# EAGLE design mbc_81_24_01_06 (EAGLE 7.6.0)

## Sheet 1 of 2
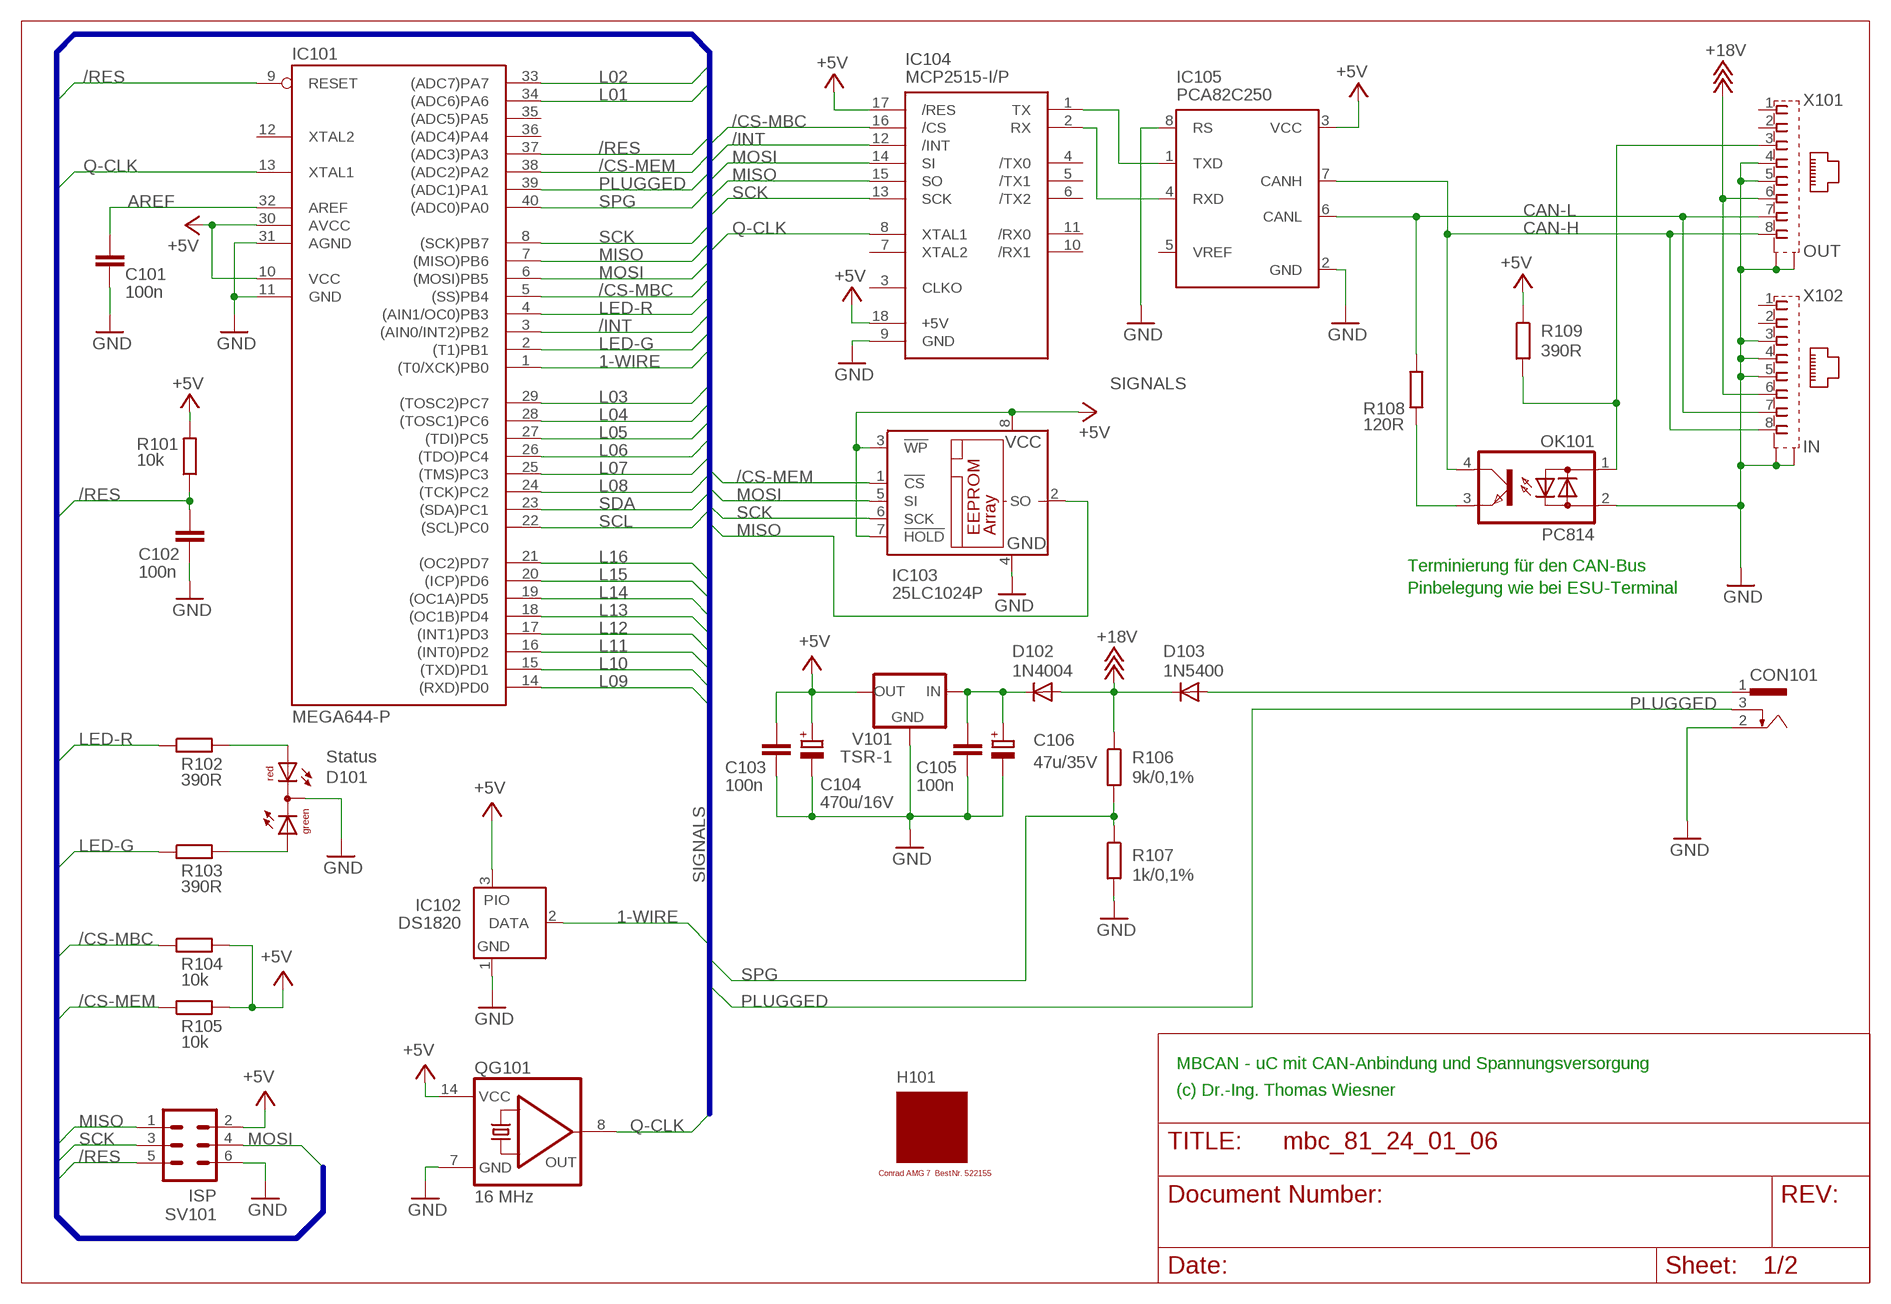
[diagram p0: schematic, sheet 1]

### Parts
C101  100n  C-EU025-025X050  [C025-025X050]
C102  100n  C-EU025-025X050  [C025-025X050]
C103  100n  C-EU025-025X050  [C025-025X050]
C104  470u/16V  CPOL-EUE3.5-8  [E3,5-8]
C105  100n  C-EU025-025X050  [C025-025X050]
C106  47u/35V  CPOL-EUE2.5-7  [E2,5-7]
CON101  POWER-JACK  [POWER-JACK]
D101  Status  DUOLED5MM  [DUOLED5MM]
D102  1N4004  [DO41-10]
D103  1N5400  [DO201-15]
H101  MODULGEHÄUSE-AMG-7  [MODULGEHÄUSE-1]
IC101  MEGA644-P  MEGA323-P  [DIL40]
IC102  DS1820  DS2405  [TO92-]
IC103  25LC1024P  25LC040P  [DIL8]
IC104  MCP2515-I/P  MCP2510-I/P  [DIL18]
IC105  PCA82C250  [DIL08]
OK101  PC814  [DIL04]
QG101  16 MHz  QG5860  [DIL14S]
R101  10k  R-EU_0207/10  [0207/10]
R102  390R  R-EU_0207/10  [0207/10]
R103  390R  R-EU_0207/10  [0207/10]
R104  10k  R-EU_0207/10  [0207/10]
R105  10k  R-EU_0207/10  [0207/10]
R106  9k/0,1%  R-EU_0207/10  [0207/10]
R107  1k/0,1%  R-EU_0207/10  [0207/10]
R108  120R  R-EU_0207/10  [0207/10]
R109  390R  R-EU_0207/10  [0207/10]
SV101  ISP  ML6  [ML6]
V101  TSR-1  [TRACO-TSR-1]
X101  OUT  0446200002  [0446200002]
X102  IN  0446200002  [0446200002]

### Nets
1-WIRE: IC101.1((T0/XCK)PB0) IC102.2(DATA)
+5V: C103.1 C104.+ IC101.10(VCC) IC101.30(AVCC) IC102.3(PIO) IC103.3(!WP) IC103.7(!HOLD) IC103.8(VCC) IC104.17(/RES) IC104.18(+5V) IC105.3(VCC) QG101.14(VCC) R101.2 R104.2 R105.2 R109.1 SV101.2 V101.OUT ; also sheet 2
+18V: D102.A D103.C R106.1 X101.6 X102.6
/CS-MBC: IC101.5((SS)PB4) IC104.16(/CS) R104.1
/CS-MEM: IC101.38((ADC2)PA2) IC103.1(!CS) R105.1
/INT: IC101.3((AIN0/INT2)PB2) IC104.12(/INT)
/RES: C102.1 IC101.9(RESET) IC101.37((ADC3)PA3) R101.1 SV101.5
AREF: C101.1 IC101.32(AREF)
CAN-H: IC105.7(CANH) OK101.4(C) X101.8 X102.8
CAN-L: IC105.6(CANL) R108.2 X101.7 X102.7
GND: C101.2 C102.2 C103.2 C104.- C105.2 C106.- CON101.2 D101.K(C) IC101.11(GND) IC101.31(AGND) IC102.1(GND) IC103.4(GND) IC104.9(GND) IC105.2(GND) IC105.8(RS) OK101.2(AC2) QG101.7(GND) R107.2 SV101.6 V101.GND X101.4 X101.5 X101.S@1(S1) X101.S@2(S2) X102.3 X102.4 X102.5 X102.S@1(S1) X102.S@2(S2) ; also sheet 2
L01: IC101.34((ADC6)PA6) ; also sheet 2
L02: IC101.33((ADC7)PA7) ; also sheet 2
L03: IC101.29((TOSC2)PC7) ; also sheet 2
L04: IC101.28((TOSC1)PC6) ; also sheet 2
L05: IC101.27((TDI)PC5) ; also sheet 2
L06: IC101.26((TDO)PC4) ; also sheet 2
L07: IC101.25((TMS)PC3) ; also sheet 2
L08: IC101.24((TCK)PC2) ; also sheet 2
L09: IC101.14((RXD)PD0) ; also sheet 2
L10: IC101.15((TXD)PD1) ; also sheet 2
L11: IC101.16((INT0)PD2) ; also sheet 2
L12: IC101.17((INT1)PD3) ; also sheet 2
L13: IC101.18((OC1B)PD4) ; also sheet 2
L14: IC101.19((OC1A)PD5) ; also sheet 2
L15: IC101.20((ICP)PD6) ; also sheet 2
L16: IC101.21((OC2)PD7) ; also sheet 2
LED-G: IC101.2((T1)PB1) R103.1
LED-R: IC101.4((AIN1/OC0)PB3) R102.1
MISO: IC101.7((MISO)PB6) IC103.2(SO) IC104.15(SO) SV101.1
MOSI: IC101.6((MOSI)PB5) IC103.5(SI) IC104.14(SI) SV101.4
N$1: IC104.1(TX) IC105.1(TXD)
N$2: IC104.2(RX) IC105.4(RXD)
N$3: OK101.3(E) R108.1
N$5: OK101.1(AC1) R109.2 X101.3
N$6: C105.1 C106.+ D102.C V101.IN
N$9: D101.AR R102.2
N$13: D101.AG R103.2
PLUGGED: CON101.3 IC101.39((ADC1)PA1)
Q-CLK: IC101.13(XTAL1) IC104.8(XTAL1) QG101.8(OUT)
SCK: IC101.8((SCK)PB7) IC103.6(SCK) IC104.13(SCK) SV101.3
SCL: IC101.22((SCL)PC0) ; also sheet 2
SDA: IC101.23((SDA)PC1) ; also sheet 2
SPG: IC101.40((ADC0)PA0) R106.2 R107.1
V-NETZTEIL1: CON101.1 D103.A
Unconnected: IC101.12(XTAL2) IC101.35((ADC5)PA5) IC101.36((ADC4)PA4) IC104.3(CLKO) IC104.4(/TX0) IC104.5(/TX1) IC104.6(/TX2) IC104.7(XTAL2) IC104.10(/RX1) IC104.11(/RX0) IC105.5(VREF) X101.1 X101.2 X102.1 X102.2

### Buses
SIGNALS

### Notes on the sheet
- Terminierung für den CAN-Bus
- Pinbelegung wie bei ESU-Terminal
- MBCAN - uC mit CAN-Anbindung und Spannungsversorgung
- (c) Dr.-Ing. Thomas Wiesner

## Sheet 2 of 2
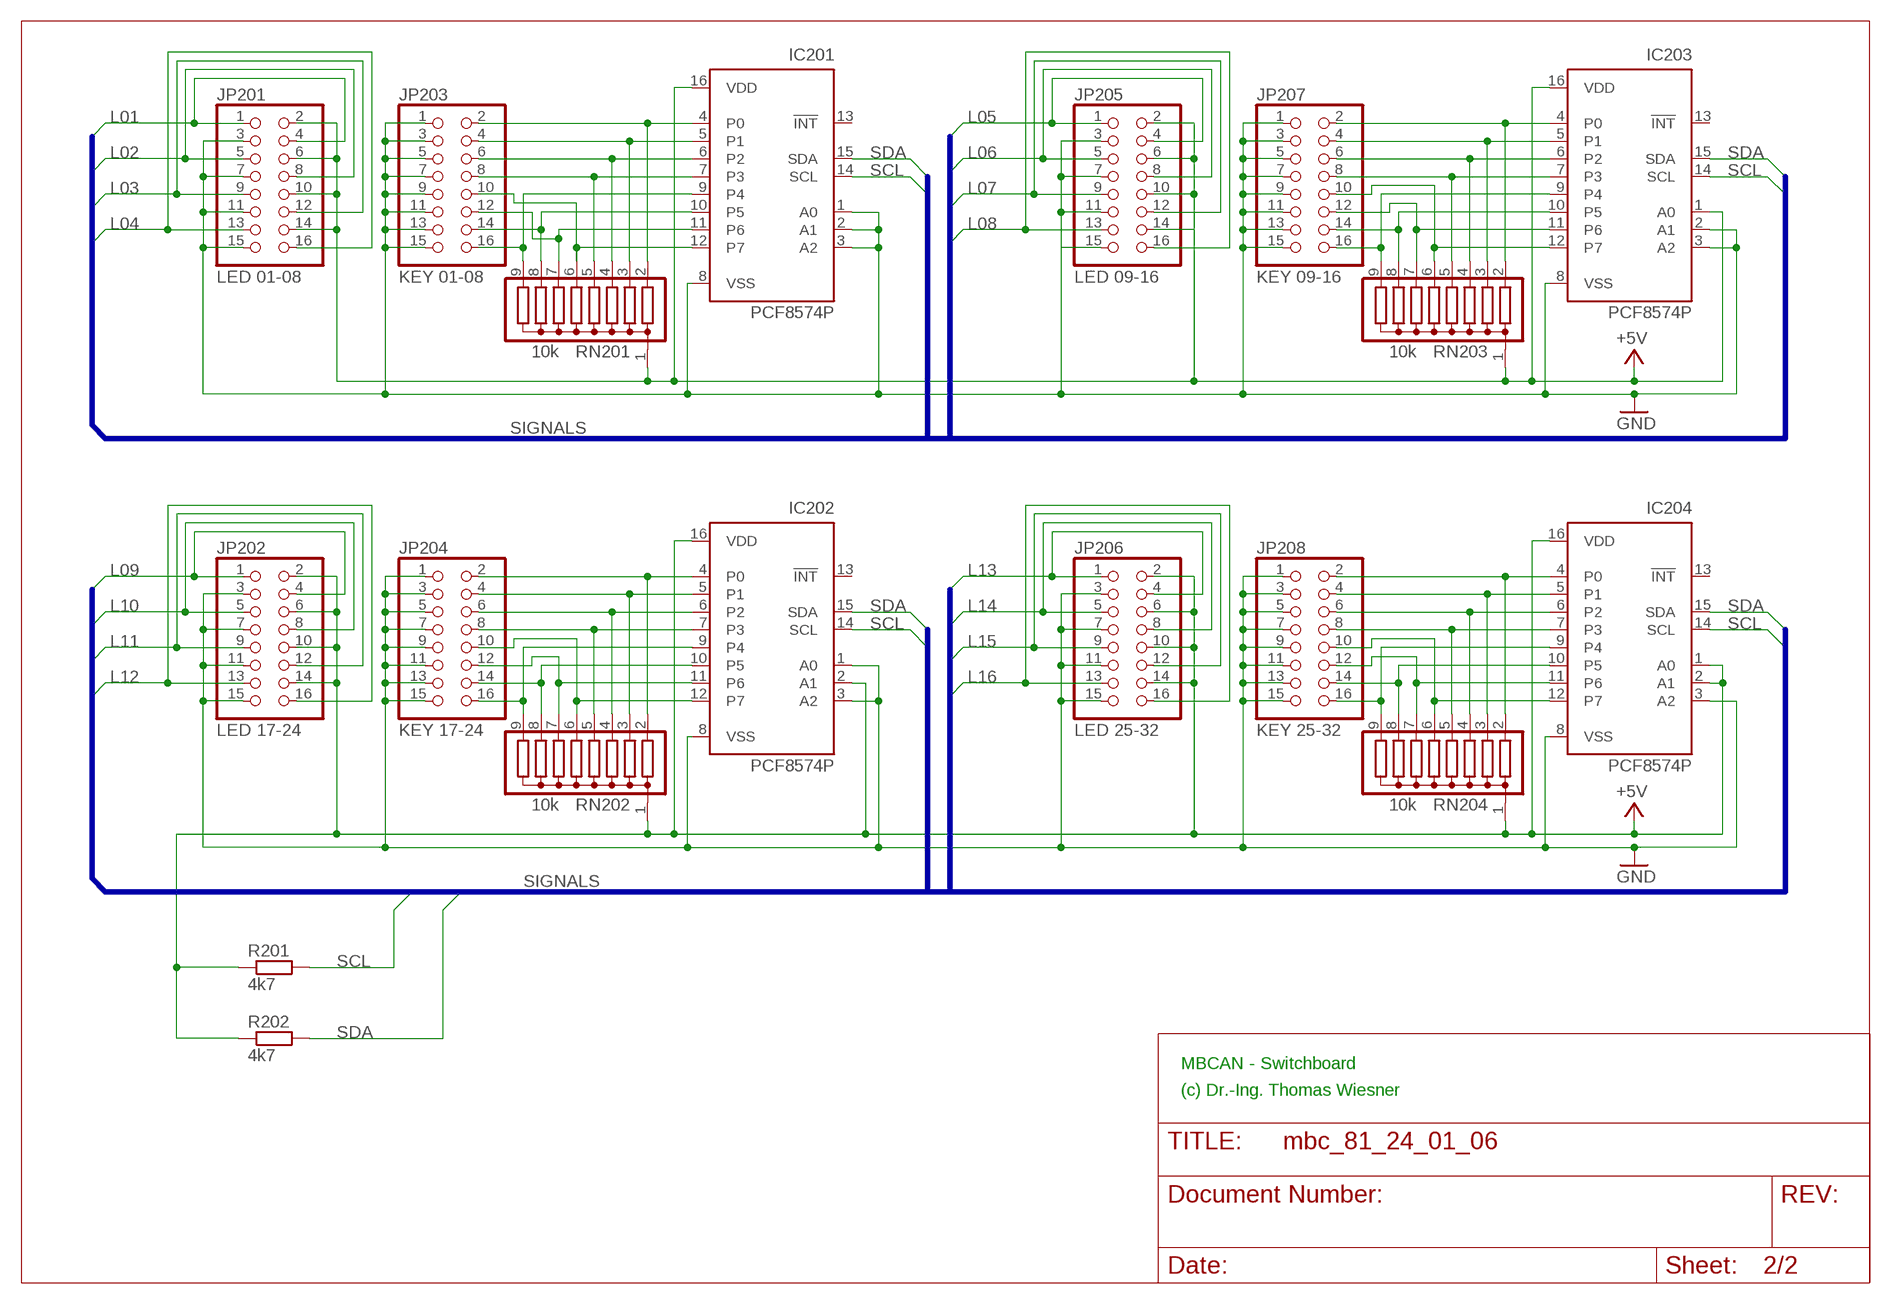
[diagram p1: schematic, sheet 2]

### Parts
IC201  PCF8574P  [DIL16]
IC202  PCF8574P  [DIL16]
IC203  PCF8574P  [DIL16]
IC204  PCF8574P  [DIL16]
JP201  LED 01-08  PINHD-2X8  [2X08]
JP202  LED 17-24  PINHD-2X8  [2X08]
JP203  KEY 01-08  PINHD-2X8  [2X08]
JP204  KEY 17-24  PINHD-2X8  [2X08]
JP205  LED 09-16  PINHD-2X8  [2X08]
JP206  LED 25-32  PINHD-2X8  [2X08]
JP207  KEY 09-16  PINHD-2X8  [2X08]
JP208  KEY 25-32  PINHD-2X8  [2X08]
R201  4k7  R-EU_0207/10  [0207/10]
R202  4k7  R-EU_0207/10  [0207/10]
RN201  10k  G08R  [SIL9]
RN202  10k  G08R  [SIL9]
RN203  10k  G08R  [SIL9]
RN204  10k  G08R  [SIL9]

### Nets
+5V: IC201.16(VDD) IC202.2(A1) IC202.16(VDD) IC203.1(A0) IC203.16(VDD) IC204.1(A0) IC204.2(A1) IC204.16(VDD) JP201.2 JP201.6 JP201.10 JP201.14 JP202.2 JP202.6 JP202.10 JP202.14 JP205.2 JP205.6 JP205.10 JP205.14 JP206.2 JP206.6 JP206.10 JP206.14 R201.1 R202.1 RN201.1 RN202.1 RN203.1 RN204.1 ; also sheet 1
GND: IC201.1(A0) IC201.2(A1) IC201.3(A2) IC201.8(VSS) IC202.1(A0) IC202.3(A2) IC202.8(VSS) IC203.2(A1) IC203.3(A2) IC203.8(VSS) IC204.3(A2) IC204.8(VSS) JP201.3 JP201.7 JP201.11 JP201.15 JP202.3 JP202.7 JP202.11 JP202.15 JP203.1 JP203.3 JP203.5 JP203.7 JP203.9 JP203.11 JP203.13 JP203.15 JP204.1 JP204.3 JP204.5 JP204.7 JP204.9 JP204.11 JP204.13 JP204.15 JP205.3 JP205.7 JP205.11 JP205.15 JP206.3 JP206.7 JP206.11 JP206.15 JP207.1 JP207.3 JP207.5 JP207.7 JP207.9 JP207.11 JP207.13 JP207.15 JP208.1 JP208.3 JP208.5 JP208.7 JP208.9 JP208.11 JP208.13 JP208.15 ; also sheet 1
L01: JP201.1 JP201.4 ; also sheet 1
L02: JP201.5 JP201.8 ; also sheet 1
L03: JP201.9 JP201.12 ; also sheet 1
L04: JP201.13 JP201.16 ; also sheet 1
L05: JP205.1 JP205.4 ; also sheet 1
L06: JP205.5 JP205.8 ; also sheet 1
L07: JP205.9 JP205.12 ; also sheet 1
L08: JP205.13 JP205.16 ; also sheet 1
L09: JP202.1 JP202.4 ; also sheet 1
L10: JP202.5 JP202.8 ; also sheet 1
L11: JP202.9 JP202.12 ; also sheet 1
L12: JP202.13 JP202.16 ; also sheet 1
L13: JP206.1 JP206.4 ; also sheet 1
L14: JP206.5 JP206.8 ; also sheet 1
L15: JP206.9 JP206.12 ; also sheet 1
L16: JP206.13 JP206.16 ; also sheet 1
N$15: IC202.4(P0) JP204.2 RN202.2
N$16: IC202.5(P1) JP204.4 RN202.3
N$17: IC202.6(P2) JP204.6 RN202.4
N$18: IC202.7(P3) JP204.8 RN202.5
N$19: IC202.12(P7) JP204.10 RN202.6
N$20: IC202.11(P6) JP204.12 RN202.7
N$21: IC202.10(P5) JP204.14 RN202.8
N$22: IC202.9(P4) JP204.16 RN202.9
N$23: IC201.4(P0) JP203.2 RN201.2
N$24: IC201.5(P1) JP203.4 RN201.3
N$25: IC201.6(P2) JP203.6 RN201.4
N$26: IC201.7(P3) JP203.8 RN201.5
N$27: IC201.9(P4) JP203.16 RN201.9
N$28: IC201.10(P5) JP203.14 RN201.8
N$29: IC201.11(P6) JP203.12 RN201.7
N$31: IC203.4(P0) JP207.2 RN203.2
N$32: IC203.5(P1) JP207.4 RN203.3
N$33: IC203.6(P2) JP207.6 RN203.4
N$34: IC203.7(P3) JP207.8 RN203.5
N$35: IC203.12(P7) JP207.10 RN203.6
N$36: IC203.11(P6) JP207.12 RN203.7
N$37: IC203.10(P5) JP207.14 RN203.8
N$38: IC203.9(P4) JP207.16 RN203.9
N$39: IC204.4(P0) JP208.2 RN204.2
N$40: IC204.5(P1) JP208.4 RN204.3
N$41: IC204.6(P2) JP208.6 RN204.4
N$42: IC204.7(P3) JP208.8 RN204.5
N$43: IC204.12(P7) JP208.10 RN204.6
N$44: IC204.11(P6) JP208.12 RN204.7
N$45: IC204.10(P5) JP208.14 RN204.8
N$46: IC204.9(P4) JP208.16 RN204.9
N$47: IC201.12(P7) JP203.10 RN201.6
SCL: IC201.14(SCL) IC202.14(SCL) IC203.14(SCL) IC204.14(SCL) R201.2 ; also sheet 1
SDA: IC201.15(SDA) IC202.15(SDA) IC203.15(SDA) IC204.15(SDA) R202.2 ; also sheet 1
Unconnected: IC201.13(!INT) IC202.13(!INT) IC203.13(!INT) IC204.13(!INT)

### Buses
SIGNALS

### Notes on the sheet
- MBCAN - Switchboard
- (c) Dr.-Ing. Thomas Wiesner

## Library data of the parts
C101-C103 C105 = rcl:C-EU: CAPACITOR, European symbol
C104 C106 = rcl:CPOL-EU: POLARIZED CAPACITOR, European symbol
CON101 = mbc:POWER-JACK
D101 = led:DUOLED5MM: DUO LED 2 colors, 5 mm, round
D102 = diode:1N4004: DIODE general purpose rectifier, 1 A
D103 = diode:1N5400: DIODE standard rectifier, 3 A, 50 V (Motorola)
H101 = mbc:MODULGEHÄUSE-AMG-7: Gehäuse Conrad AMG 7 BestNr. 522155
IC101 = atmel:MEGA323-P: MICROCONTROLLER 32 Kbytes FLASH 2 Kbytes SRAM 1 Kbytes EEPROM USART 8-channel 10 bit ADC Source: avr.lbr; OC_FARNELL: unknown; OC_NEWARK: unknown
IC102 = maxim:DS2405: Addressable Switch DALLAS Semiconductor; MF: DALLAS SEMICONDUCTOR; MPN: DS2405; OC_FARNELL: 1188025; OC_NEWARK: 06F4645
IC103 = microchip:25*: Serial EEPROM 4K/ 8K , SPI bus; MF: MICROCHIP; MPN: 25LC040/P; OC_FARNELL: 9758100; OC_NEWARK: 96K4091
IC104 = mbc:MCP2510: BASIC-CAN 2.0a Controller Stand-alone CAN controller von Microchip
IC105 = micro-philips:PCA82C250: CAN CONTROLLER INTERFACE; OC_FARNELL: 3692358; OC_NEWARK: unknown
IC201-IC204 = micro-philips:PCF8574: I2C-Bus Remote 8-bit I/O expander http://www.semiconductors.philips.com/acrobat_download/datasheets/PCF8574_4.pdf; MPN: PCF8574PN; OC_FARNELL: 204020; OC_NEWARK: 11N8515
JP201-JP208 = pinhead:PINHD-2X8: PIN HEADER
OK101 = optocoupler:PC814: SHARP OPTO COUPLER; OC_FARNELL: 9707662; OC_NEWARK: unknown
QG101 = crystal:QG5860: CRYSTAL RESONATOR; OC_FARNELL: unknown; OC_NEWARK: unknown
R101-R109 = resistor:R-EU_: RESISTOR, European symbol
R201 R202 = rcl:R-EU_: RESISTOR, European symbol
RN201-RN204 = resistor-sil:G08R: SIL RESISTOR; OC_FARNELL: unknown; OC_NEWARK: unknown
SV101 = con-ml:ML6: HARTING; OC_FARNELL: unknown; OC_NEWARK: unknown
V101 = mbc:TSR-1: Spannungsregler Hersteller: TRACO Typ: TSR-1 5V: TSR 1-2450 Spg: 5V Strom: 1A Reichelt TSR 1-2450
X101 X102 = mbc:0446200002: RJ-45 INVERTED MODULAR JACK ASSEMBLY WITH RJ-11 KEEPOUT FEATURE Source: Data sheet <http://www.farnell.com/datasheets/73207.pdf> MOLEX 0446200002 BUCHSE, RJ45, GESCHIRMT Source: Farnell <http://de.farnell.com/molex/0446200002/buchse-rj45-geschirmt/dp/9251910?ost=9251910>; MF: MOLEX; MPN: 0446200002; OC_FARNELL: 9251910

## Board
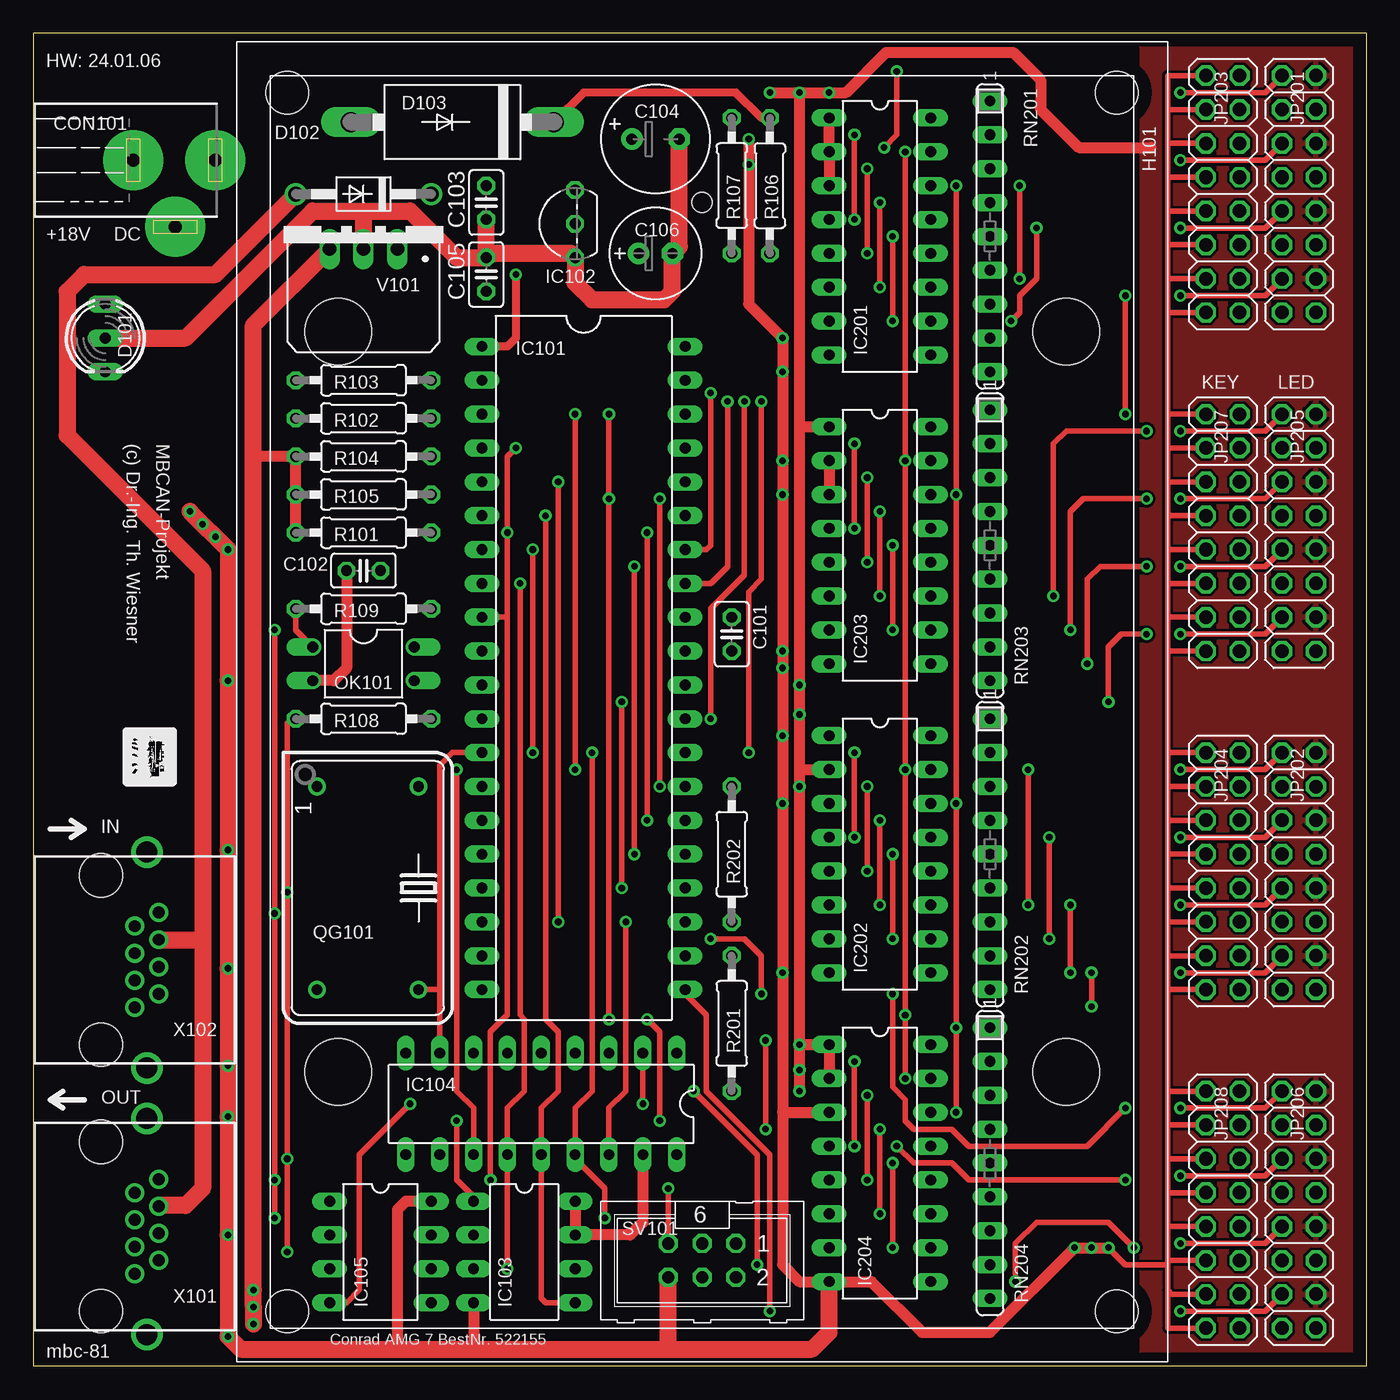
[diagram p2: board, top side]
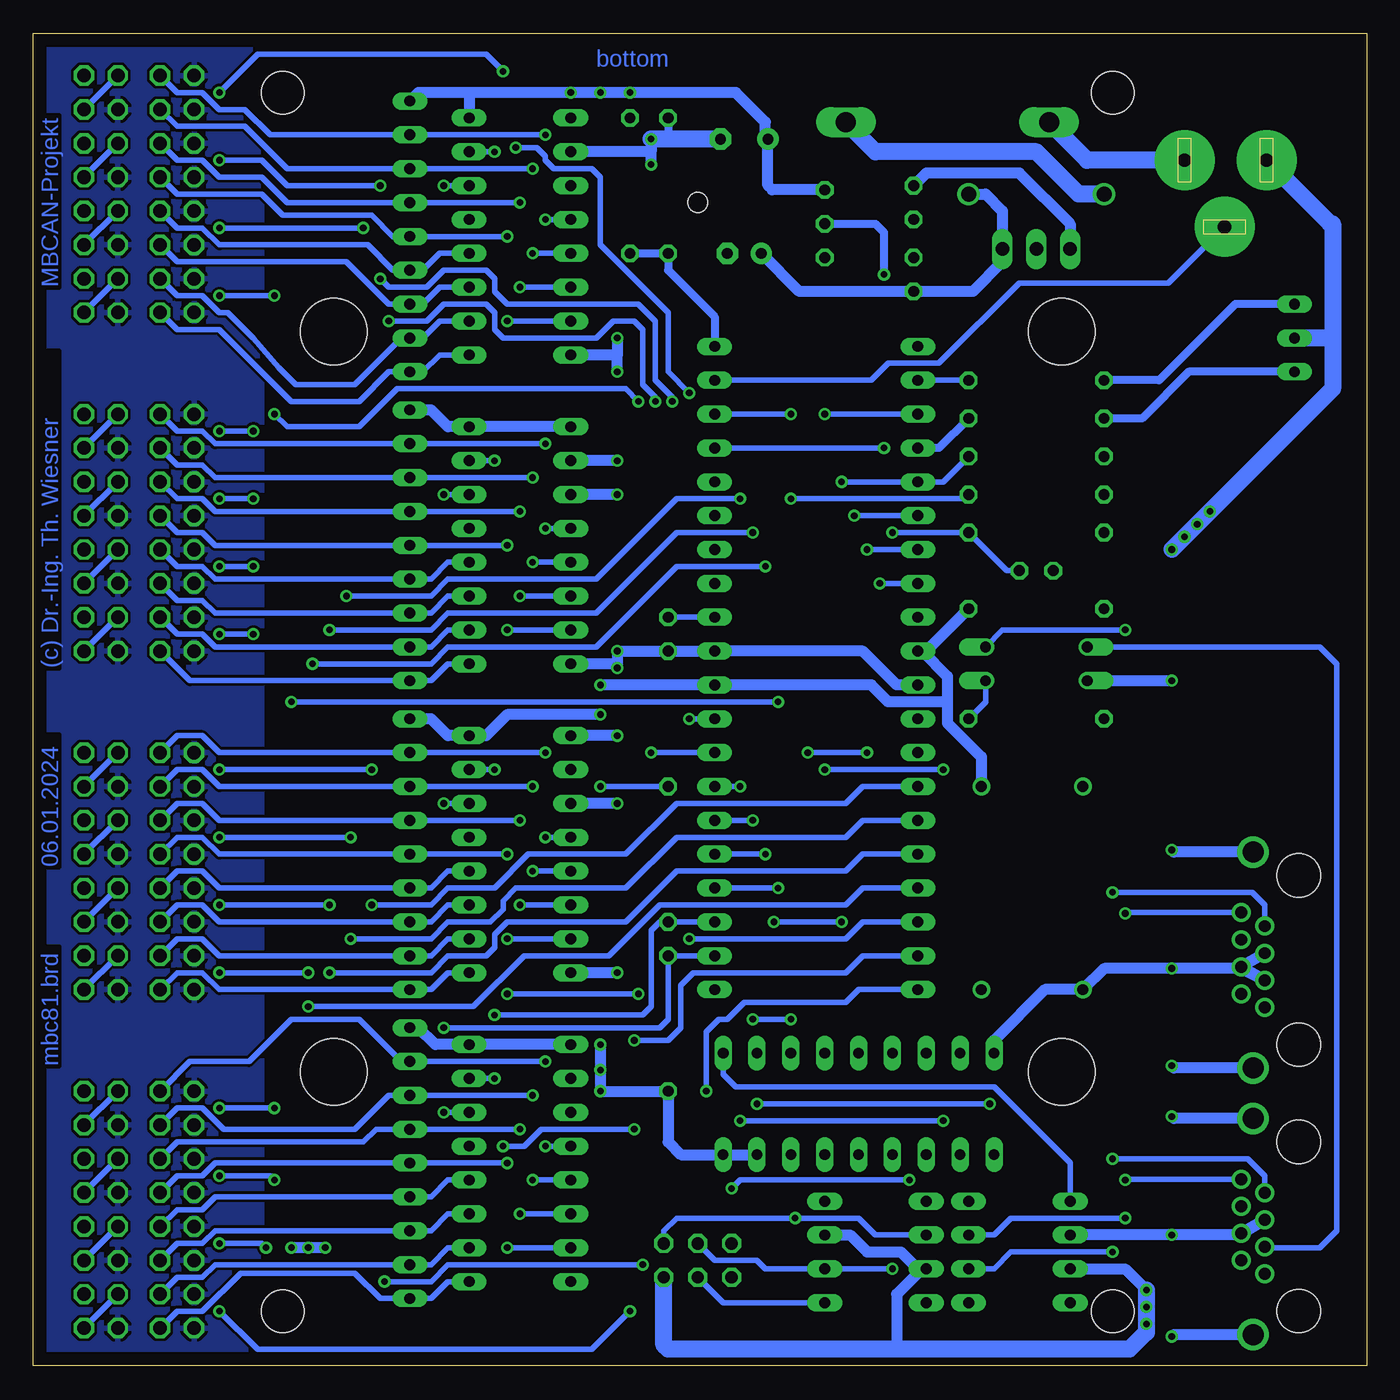
[diagram p3: board, bottom side, seen from below]

Size 100 x 99.99 mm. Coordinates in mm from the lower left corner, seen from the top.
Outline: 0,99.99 0,0 100,0 100,99.99 0,99.99
Copper layers (1*16): Top 0.035mm / dielectric 1.5mm / Bottom 0.035mm
Design rules "default *": minimum track width 10mil, minimum drill 0.5mm, track to track 8mil, track to pad 8mil, pad to pad 8mil, via to via 8mil, smd to smd 8mil, copper to edge 40mil, drill to drill 8mil, minimum pad ring 10mil, minimum via ring 8mil, stop-mask expansion 4mil, vias tented up to drill 0mil, thermal gap 10mil

### Footprints (pad centres in the part's own frame; a part is rotated, then mirrored left to right if it is on the bottom)
C025-025X050 = drill 0.813 octagon: 1 -1.27,0; 2 1.27,0
E3,5-8 = drill 0.813 pad 1.6: + -1.778,0 | drill 0.813 pad 1.6 octagon: - 1.778,0
E2,5-7 = drill 0.813 pad 1.6: + -1.27,0 | drill 0.813 pad 1.6 octagon: - 1.27,0
POWER-JACK = drill 1 pad 4.5: 1 0,6.03; 2 0,-0.12; 3 5,3.03
DUOLED5MM = drill 0.813 long: AG -2.54,0; AR 2.54,0; K 0,0
DO41-10 = drill 1.118: A 5.08,0; C -5.08,0
DO201-15 = drill 1.499 long: A 7.62,0; C -7.62,0
MODULGEHÄUSE-1 = hole 3.2: -45.72,-31.115; -45.72,31.115; 45.72,31.115; 45.72,-31.115 | hole 5: -27.781,-27.305; 27.781,-27.305; -27.781,27.305; 27.781,27.305 | hole 1.5: -37.465,0
DIL40 = drill 0.813 long: 1 -24.13,-7.62; 2 -21.59,-7.62; 3 -19.05,-7.62; 4 -16.51,-7.62; 5 -13.97,-7.62; 6 -11.43,-7.62; 7 -8.89,-7.62; 8 -6.35,-7.62; 9 -3.81,-7.62; 10 -1.27,-7.62; 11 1.27,-7.62; 12 3.81,-7.62; 13 6.35,-7.62; 14 8.89,-7.62; 15 11.43,-7.62; 16 13.97,-7.62; 17 16.51,-7.62; 18 19.05,-7.62; 19 21.59,-7.62; 20 24.13,-7.62; 21 24.13,7.62; 22 21.59,7.62; 23 19.05,7.62; 24 16.51,7.62; 25 13.97,7.62; 26 11.43,7.62; 27 8.89,7.62; 28 6.35,7.62; 29 3.81,7.62; 30 1.27,7.62; 31 -1.27,7.62; 32 -3.81,7.62; 33 -6.35,7.62; 34 -8.89,7.62; 35 -11.43,7.62; 36 -13.97,7.62; 37 -16.51,7.62; 38 -19.05,7.62; 39 -21.59,7.62; 40 -24.13,7.62
TO92- = drill 0.813 octagon: 1 -2.54,0; 2 0,0; 3 2.54,0
DIL8 = drill 0.813 long: 1 -3.81,-3.81; 2 -1.27,-3.81; 3 1.27,-3.81; 4 3.81,-3.81; 5 3.81,3.81; 6 1.27,3.81; 7 -1.27,3.81; 8 -3.81,3.81
DIL18 = drill 0.813 long: 1 -10.16,-3.81; 2 -7.62,-3.81; 3 -5.08,-3.81; 4 -2.54,-3.81 | drill 0.8 long: 5 0,-3.81; 6 2.54,-3.81; 7 5.08,-3.81; 8 7.62,-3.81; 9 10.16,-3.81; 10 10.16,3.81; 11 7.62,3.81; 12 5.08,3.81; 13 2.54,3.81; 14 0,3.81; 15 -2.54,3.81; 16 -5.08,3.81; 17 -7.62,3.81; 18 -10.16,3.81
DIL08 = drill 0.813 long: 1 -3.81,-3.81; 2 -1.27,-3.81; 3 1.27,-3.81; 4 3.81,-3.81; 5 3.81,3.81; 6 1.27,3.81; 7 -1.27,3.81; 8 -3.81,3.81
DIL16 = drill 0.813 long: 1 -8.89,-3.81; 2 -6.35,-3.81; 3 -3.81,-3.81; 4 -1.27,-3.81; 5 1.27,-3.81; 6 3.81,-3.81; 7 6.35,-3.81; 8 8.89,-3.81; 9 8.89,3.81; 10 6.35,3.81; 11 3.81,3.81; 12 1.27,3.81; 13 -1.27,3.81; 14 -3.81,3.81; 15 -6.35,3.81; 16 -8.89,3.81
2X08 = drill 1.016 octagon: 1 -8.89,-1.27; 2 -8.89,1.27; 3 -6.35,-1.27; 4 -6.35,1.27; 5 -3.81,-1.27; 6 -3.81,1.27; 7 -1.27,-1.27; 8 -1.27,1.27; 9 1.27,-1.27; 10 1.27,1.27; 11 3.81,-1.27; 12 3.81,1.27; 13 6.35,-1.27; 14 6.35,1.27; 15 8.89,-1.27; 16 8.89,1.27
DIL04 = drill 0.813 offset: 1 -1.27,-3.81; 2 1.27,-3.81; 3 1.27,3.81; 4 -1.27,3.81
DIL14S = drill 0.813: 1 -7.62,-3.81; 7 7.62,-3.81; 8 7.62,3.81; 14 -7.62,3.81
0207/10 = drill 0.813 octagon: 1 -5.08,0; 2 5.08,0
SIL9 = drill 0.813 long: 1 -10.16,0; 2 -7.62,0; 3 -5.08,0; 4 -2.54,0; 5 0,0; 6 2.54,0; 7 5.08,0; 8 7.62,0; 9 10.16,0
ML6 = drill 0.914 octagon: 1 -2.54,-1.27; 2 -2.54,1.27; 3 0,-1.27; 4 0,1.27; 5 2.54,-1.27; 6 2.54,1.27
TRACO-TSR-1 = drill 1.016 long: GND 0,2.54; IN -2.54,2.54; OUT 2.54,2.54
0446200002 = drill 0.889 pad 1.422: 1 3.556,2.54; 2 2.54,4.318; 3 1.524,2.54; 4 0.508,4.318; 5 -0.508,2.54; 6 -1.524,4.318; 7 -2.54,2.54; 8 -3.556,4.318 | drill 1.575 pad 2.286: S@1 -8.103,3.429; S@2 8.103,3.429 | hole 3.251: 6.35,0; -6.35,0

### Placement (x,y rotation side)
C101  52.39,54.91 270 top
C102  24.77,59.67 180 top
C103  33.97,87.29 270 top
C104  46.67,92.06 0 top
C105  33.97,81.9 90 top
C106  46.67,83.48 0 top
CON101  7.62,90.47 270 top
D101  5.4,77.13 270 top
D102  24.77,87.93 180 top
D103  31.43,93.33 180 top
H101  50.16,49.83 270 top
IC101  41.27,52.37 270 top
IC102  40.64,85.7 90 top
IC103  36.83,8.55 270 top
IC104  38.1,19.66 180 top
IC105  26.04,8.55 270 top
IC201  63.5,84.75 270 top
IC202  63.5,38.4 270 top
IC203  63.5,61.57 270 top
IC204  63.5,15.22 270 top
JP201  94.93,87.93 270 top
JP202  94.93,37.13 270 top
JP203  89.22,87.93 270 top
JP204  89.22,37.13 270 top
JP205  94.93,62.53 270 top
JP206  94.93,11.73 270 top
JP207  89.22,62.53 270 top
JP208  89.22,11.73 270 top
OK101  24.77,52.68 270 top
QG101  25.08,35.86 270 top
R101  24.77,62.53 180 top
R102  24.77,71.1 180 top
R103  24.77,73.96 180 top
R104  24.77,68.24 180 top
R105  24.77,65.39 180 top
R106  55.24,88.56 270 top
R107  52.39,88.56 90 top
R108  24.77,48.56 180 top
R109  24.77,56.81 180 top
R201  52.39,25.7 90 top
R202  52.39,38.4 270 top
RN201  71.75,84.75 270 top
RN202  71.75,38.4 270 top
RN203  71.75,61.57 270 top
RN204  71.75,15.22 270 top
SV101  50.16,7.92 180 top
V101  24.77,86.34 180 top
X101  5.08,10.46 270 top
X102  5.08,30.46 270 top

### Tracks (layer width: path | path; a pad name or v marks a point on that pad's centre or on a via)
1-WIRE  (via drill 0.5)
  Top 0.61: v36.2,81.9 36.2,77.13 35.56,76.5 IC101.1
  Bottom 0.61: IC102.2 36.83,85.7 36.2,85.07 v36.2,81.9
+5V  (via drill 0.5)
  Top 0.813: v57.47,95.55 v59.69,95.55 60.96,95.55 63.98,98.56 73.5,98.56 75.56,96.5 75.56,94.28 78.42,91.42 83.82,91.42 | v55.24,95.55 v57.47,95.55 | v57.47,95.55 57.47,70.47 | 57.47,70.47 v57.47,51.1 v57.47,48.88 57.47,44.75 | 57.47,44.75 v57.47,43.48 v57.47,24.11 | 57.47,70.47 IC203.1 | 57.47,44.75 IC202.2 | v57.47,24.11 IC204.1 IC204.2 | v57.47,24.11 v57.47,22.21 v57.47,20.62 | R101.2 R105.2 R104.2 16.51,68.24 | IC104.17 45.72,10.78 44.77,9.82 IC103.7 IC103.8
  Top 1.27: V101.OUT 16.51,78.09 16.51,68.24 v16.51,5.7 v16.51,4.43 v16.51,3.15
  Bottom 0.406: C104.+ 45.09,92.25 | v57.47,43.48 R202.1
  Bottom 0.813: IC104.17 IC104.18 51.44,15.86 52.39,16.81 R201.1 v57.47,20.62 v57.47,22.21 v57.47,24.11 | 33.34,53.64 31.43,51.73 31.43,49.83 | QG101.14 28.89,45.7 31.43,48.24 31.43,49.83 | IC102.3 44.58,88.25 44.9,88.56 C104.+ | V101.OUT 22.23,85.7 26.04,89.52 33.02,89.52 C103.1 | 45.09,92.25 45.09,93.33 47.31,95.55 v55.24,95.55 v57.47,95.55 v59.69,95.55 67.31,95.55 | 31.43,49.83 35.88,49.83 37.15,51.1 IC101.30 v57.47,51.1 | 67.31,95.55 71.12,95.55 RN201.1 | 67.31,95.55 IC201.16 | IC203.1 IC203.16 68.9,70.47 70.17,71.73 RN203.1 | RN202.1 70.17,48.56 68.9,47.29 IC202.16 66.04,47.29 64.45,48.88 v57.47,48.88 | RN204.1 71.12,25.38 69.85,24.11 IC204.16 IC204.1 | IC101.10 33.34,53.64 | 33.34,53.64 33.02,53.64 R109.1 | IC105.3 18.1,7.28 v16.51,5.7 | IC103.7 38.73,9.82 37.47,8.55 34.92,8.55 33.66,7.28 IC103.3 33.34,7.28 35.24,5.38 35.24,1.25
  Bottom 1.27: SV101.2 52.7,1.57 52.39,1.25 35.24,1.25 17.78,1.25 16.51,2.52 v16.51,3.15 v16.51,4.43 v16.51,5.7
  pour Top: 99.69,99.67 83.19,99.67 83.19,0.3 99.69,0.3
+18V
  Top 0.61: R106.1 54.61,93.64 52.7,95.55 41.27,95.55 D103.C
  Top 1.27: 12.7,32.05 12.7,59.67 2.54,69.83 2.54,80.62 3.81,81.9 13.65,81.9 D102.A | 12.7,32.05 12.7,13.32 11.43,12.04 9.46,12.04 X101.6 | X102.6 12.64,31.98 12.7,32.05
  Bottom 1.27: D102.A 21.59,87.93 24.77,91.1 36.83,91.1 D103.C
/CS-MBC  (via drill 0.5)
  Top 0.406: v39.37,66.34 v39.37,33.32 | v44.45,33.32 44.45,20.62 43.18,19.35 IC104.16
  Bottom 0.406: v39.37,66.34 IC101.5 31.75,66.34 R104.1 | v39.37,33.32 v44.45,33.32
/CS-MEM  (via drill 0.5)
  Top 0.406: v43.18,26.02 v43.18,65.07 v43.18,71.42 | IC103.1 33.02,12.68 31.75,13.95 v31.75,18.39 | v46.99,18.39 46.99,25.06 v46.04,26.02
  Bottom 0.406: v43.18,65.07 30.16,65.07 R105.1 | IC101.38 v43.18,71.42 | v31.75,18.39 v46.99,18.39 | v46.04,26.02 v43.18,26.02
/INT  (via drill 0.5)
  Top 0.406: IC104.12 33.02,19.35 31.75,20.62 v31.75,44.75 | v40.64,44.75 v40.64,71.42
  Bottom 0.406: v31.75,44.75 v40.64,44.75 | v40.64,71.42 IC101.3
/RES  (via drill 0.5)
  Top 0.406: 35.56,56.18 35.56,26.33 34.29,25.06 v34.29,13.95 | IC101.9 35.56,56.18 | 35.56,56.18 v35.56,62.53 35.56,68.24 v36.2,68.88 | v47.62,13.32 SV101.5
  Bottom 0.406: v36.2,68.88 IC101.37 | v35.56,62.53 R101.1 26.99,59.67 C102.1 | v34.29,13.95 46.99,13.95 v47.62,13.32
AREF
  Bottom 0.406: IC101.32 C101.1
CAN-H  (via drill 0.5)
  Top 0.406: v18.1,55.22 v18.1,33.95 v18.1,13.95 v18.1,11.09
  Bottom 0.406: X101.8 18.03,14.01 v18.1,13.95 | v18.1,55.22 27.3,55.22 OK101.4 | X102.8 18.03,34.02 v18.1,33.95 | v18.1,11.09 26.67,11.09 27.94,9.82 IC105.7
CAN-L  (via drill 0.5)
  Top 0.406: R108.2 19.37,48.56 19.05,48.24 v19.05,35.54 v19.05,15.54 v19.05,8.55
  Bottom 0.406: v19.05,8.55 26.67,8.55 27.94,7.28 IC105.6 | X101.7 7.62,14.27 8.89,15.54 v19.05,15.54 | X102.7 7.62,34.59 8.57,35.54 v19.05,35.54
GND  (via drill 0.5)
  Top 0.406: 85.09,94.28 85.09,96.82 JP203.1 | 85.09,91.74 85.09,94.28 | 85.09,89.2 85.09,91.74 | 85.09,86.66 85.09,89.2 | 85.09,84.12 85.09,86.66 | 85.09,81.58 85.09,84.12 | 85.09,79.04 85.09,81.58 | 85.09,94.28 JP203.3 | 85.09,91.74 JP203.5 | 85.09,89.2 JP203.7 | 85.09,86.66 JP203.9 | 85.09,84.12 JP203.11 | 85.09,81.58 JP203.13 | 85.09,79.04 JP203.15 | 85.09,71.42 85.09,79.04 | 85.09,68.88 85.09,71.42 | 85.09,66.34 85.09,68.88 | 85.09,63.8 85.09,66.34 | 85.09,61.26 85.09,63.8 | 85.09,58.72 85.09,61.26 | 85.09,56.18 85.09,58.72 | 85.09,53.64 85.09,56.18 | 85.09,46.02 85.09,53.64 | 85.09,43.48 85.09,46.02 | 85.09,40.94 85.09,43.48 | 85.09,38.4 85.09,40.94 | 85.09,35.86 85.09,38.4 | 85.09,33.32 85.09,35.86 | 85.09,30.78 85.09,33.32 | 85.09,28.24 85.09,30.78 | 85.09,20.62 85.09,28.24 | 85.09,18.08 85.09,20.62 | 85.09,15.54 85.09,18.08 | 85.09,13 85.09,15.54 | 85.09,10.46 85.09,13 | 85.09,7.6 85.09,5.7 | 85.09,5.7 85.09,2.84 JP208.15 | JP208.13 85.41,5.38 85.09,5.7 | 85.09,7.92 JP208.11 | 85.09,10.46 JP208.9 | 85.09,13 JP208.7 | 85.09,15.54 JP208.5 | 85.09,18.08 JP208.3 | 85.09,20.62 JP208.1 | 85.09,28.24 JP204.15 | 85.09,30.78 JP204.13 | 85.09,33.32 JP204.11 | 85.09,35.86 JP204.9 | 85.09,38.4 JP204.7 | 85.09,40.94 JP204.5 | 85.09,43.48 JP204.3 | 85.09,46.02 JP204.1 | 85.09,53.64 JP207.15 | 85.09,56.18 JP207.13 | 85.09,58.72 JP207.11 | 85.09,61.26 JP207.9 | 85.09,63.8 JP207.7 | 85.09,66.34 JP207.5 | 85.09,68.88 JP207.3 | 85.09,71.42 JP207.1 | 85.09,7.92 85.09,10.46 | v80.64,8.87 81.92,7.6 85.09,7.6 | 85.09,7.6 85.09,7.92 | v14.61,61.26 14.92,55.54
  Top 0.813: v53.66,92.06 v53.66,90.15 53.66,79.67 v56.2,77.13 v56.2,74.59 v56.2,67.92 v56.2,65.39 v56.2,53.64 v56.2,52.37 v56.2,47.29 v56.2,42.21 v56.2,29.51 56.2,19.03 | 56.2,19.03 56.2,7.6 57.47,6.33 IC204.8 62.87,6.33 66.67,2.52 71.75,2.52 v78.11,8.87 v79.38,8.87 v80.64,8.87 | 56.2,19.03 IC204.3 | IC201.1 IC201.2 IC201.3 | IC203.2 IC203.3 | C102.2 23.5,52.37 22.54,51.41 OK101.2 | IC105.8 27.94,12.36 27.3,11.73 27.3,1.25 | IC103.4 33.02,1.57 32.7,1.25
  Top 1.27: v11.75,64.12 v14.61,61.26 v14.61,51.41 v14.61,38.71 v14.61,29.82 v14.61,22.52 v14.61,18.71 v14.61,9.82 v14.61,2.2 15.56,1.25 27.3,1.25 32.7,1.25 47.62,1.25 | C104.- 48.45,83.99 C106.- 47.94,80.62 47.31,79.99 41.91,79.99 40.64,81.26 IC102.1 40.32,83.48 33.97,83.48 C105.2 | 24.77,86.66 V101.GND | 24.77,86.66 28.26,86.66 31.75,83.17 C105.2 | D101.K 11.43,77.13 20.95,86.66 24.77,86.66 | 47.62,1.25 SV101.6 | 47.62,1.25 58.42,1.25 59.69,2.52 IC204.8 | C105.2 C103.2
  Bottom 0.61: R107.2 52.39,92.37 52.7,92.06
  Bottom 0.813: IC101.11 35.24,51.1 37.78,53.64 IC101.31 C101.2 v56.2,53.64 56.2,52.68 | 53.66,91.1 IC201.2 | v53.66,92.06 53.66,91.1 | v53.66,90.15 53.66,91.1 | 56.2,75.86 IC201.8 | v56.2,77.13 56.2,75.86 | v56.2,74.59 56.2,75.86 | v56.2,67.92 IC203.2 | v56.2,65.39 IC203.3 | 56.2,52.68 IC203.8 | v56.2,52.37 56.2,52.68 | v56.2,47.29 IC202.1 | v56.2,42.21 IC202.3 | v56.2,29.51 IC202.8 | v80.64,8.87 v79.38,8.87 v78.11,8.87 | OK101.2 v14.61,51.41 | X102.S@1 14.45,38.56 v14.61,38.71 | X102.S@2 14.44,22.36 v14.61,22.52 | X101.S@1 14.45,18.56 v14.61,18.71 | X101.S@2 14.45,2.35 v14.61,2.2 | X102.5 X102.4 X102.3 9.53,29.82 v14.61,29.82 19.68,29.82 QG101.7 24.13,28.24 27.94,24.43 IC104.9 | X101.4 X101.5 9.53,9.82 v14.61,9.82 IC105.2
  Bottom 1.27: 2.54,77.13 2.54,85.7 2.74,85.7 CON101.2 | 2.54,77.13 D101.K | 2.54,77.13 2.54,73.32 v11.75,64.12 v12.7,63.16 v13.65,62.21 v14.61,61.26 | C104.- 52.7,92.06 v53.66,92.06
  pour Bottom: 99.69,99.67 82.87,99.67 82.87,0.3 99.69,0.3
L01  (via drill 0.5)
  Top 0.406: JP201.1 92.39,95.55 v86.04,95.55 | v64.77,97.14 64.77,92.37 v63.82,91.42 | v50.8,73.01 50.8,61.57 50.48,61.26 IC101.34
  Bottom 0.406: JP201.1 JP201.4 | v86.04,95.55 83.19,98.41 66.04,98.41 v64.77,97.14 | v63.82,91.42 62.23,91.42 61.59,90.79 61.59,90.47 60.96,89.83 58.1,89.83 57.47,89.2 57.47,84.12 52.39,79.04 52.39,74.59 v50.8,73.01
L02  (via drill 0.5)
  Top 0.406: JP201.5 92.39,90.47 v86.04,90.47 | v73.98,81.58 v73.98,88.56 | v52.07,72.37 52.07,59.99 50.8,58.72 IC101.33
  Bottom 0.406: JP201.5 JP201.8 | v86.04,90.47 82.87,90.47 80.96,88.56 v73.98,88.56 | v73.98,81.58 73.34,80.94 70.48,80.94 69.22,82.21 66.04,82.21 65.41,81.58 65.41,80.62 64.45,79.67 54.61,79.67 53.34,78.4 53.34,73.96 52.07,72.69 v52.07,72.37
L03  (via drill 0.5)
  Top 0.406: JP201.9 92.39,85.39 v86.04,85.39 | v75.25,85.39 75.25,81.58 73.98,80.31 73.98,79.04 v73.34,78.4 | v53.34,72.37 53.34,59.35 50.8,56.81 v50.8,48.56
  Bottom 0.406: JP201.9 JP201.12 | v75.25,85.39 v86.04,85.39 | v73.34,78.4 70.48,78.4 69.22,79.67 66.04,79.67 65.41,79.04 65.41,77.77 64.77,77.13 57.78,77.13 56.52,78.4 54.93,78.4 54.29,77.77 54.29,73.64 53.34,72.69 v53.34,72.37 | v50.8,48.56 IC101.29
L04  (via drill 0.5)
  Top 0.406: JP201.13 92.39,80.31 v86.04,80.31 | v81.92,71.42 v81.92,80.31 | v54.61,72.37 54.61,59.03 53.66,58.08 v53.66,46.02
  Bottom 0.406: JP201.13 JP201.16 | v81.92,80.31 v86.04,80.31 | v81.92,71.42 80.96,70.47 75.56,70.47 72.71,73.32 55.56,73.32 v54.61,72.37 | v53.66,46.02 IC101.28
L05  (via drill 0.5)
  Top 0.406: JP205.1 92.39,70.15 v86.04,70.15 | v46.99,65.07 v46.99,43.48 | v76.52,57.76 76.52,69.2 77.47,70.15 v83.5,70.15
  Bottom 0.406: JP205.1 JP205.4 | v46.99,43.48 IC101.27 | v46.99,65.07 51.75,65.07 57.78,59.03 68.9,59.03 70.17,57.76 v76.52,57.76 | v83.5,70.15 v86.04,70.15
L06  (via drill 0.5)
  Top 0.406: JP205.5 92.39,65.07 v86.04,65.07 | v83.5,65.07 78.74,65.07 77.79,64.12 v77.79,55.22 | v46.04,62.53 v46.04,40.94
  Bottom 0.406: JP205.5 JP205.8 | v83.5,65.07 v86.04,65.07 | v77.79,55.22 70.17,55.22 68.9,56.49 57.78,56.49 51.75,62.53 v46.04,62.53 | v46.04,40.94 IC101.26
L07  (via drill 0.5)
  Top 0.406: JP205.9 92.39,59.99 v86.04,59.99 | v83.5,59.99 80.01,59.99 79.06,59.03 v79.06,52.68 | v45.09,59.99 v45.09,38.4
  Bottom 0.406: JP205.9 JP205.12 | v83.5,59.99 v86.04,59.99 | v79.06,52.68 70.17,52.68 68.9,53.95 57.78,53.95 51.75,59.99 v45.09,59.99 | v45.09,38.4 IC101.25
L08  (via drill 0.5)
  Top 0.406: JP205.13 92.39,54.91 v86.04,54.91 | v83.5,54.91 81.6,54.91 80.64,53.95 v80.64,49.83 | v44.13,49.83 v44.13,35.86
  Bottom 0.406: JP205.13 JP205.16 | v83.5,54.91 v86.04,54.91 | v44.13,49.83 v80.64,49.83 | v44.13,35.86 IC101.24
L09  (via drill 0.5)
  Top 0.406: JP202.1 92.39,44.75 v86.04,44.75 | v74.61,34.59 v74.61,44.75
  Bottom 0.406: JP202.1 JP202.4 | v74.61,44.75 v86.04,44.75 | v74.61,34.59 70.17,34.59 68.9,35.86 65.41,35.86 62.87,38.4 55.56,38.4 51.75,42.21 39.05,42.21 37.78,43.48 IC101.14
L10  (via drill 0.5)
  Top 0.406: JP202.5 92.39,39.67 v86.04,39.67 | v76.2,32.05 v76.2,39.67
  Bottom 0.406: JP202.5 JP202.8 | v76.2,39.67 v86.04,39.67 | v76.2,32.05 70.17,32.05 68.9,33.32 65.72,33.32 64.77,34.27 64.77,34.9 63.82,35.86 55.56,35.86 51.75,39.67 39.05,39.67 37.78,40.94 IC101.15
L11  (via drill 0.5)
  Top 0.406: JP202.9 92.39,34.59 v86.04,34.59 | v77.79,29.51 v77.79,34.59
  Bottom 0.406: JP202.9 JP202.12 | v77.79,34.59 v86.04,34.59 | v77.79,29.51 70.17,29.51 68.9,30.78 66.04,30.78 65.41,31.41 65.41,32.36 64.45,33.32 55.56,33.32 51.75,37.13 39.05,37.13 37.78,38.4 IC101.16
L12  (via drill 0.5)
  Top 0.406: JP202.13 92.39,29.51 v86.04,29.51 | v79.38,26.97 v79.38,29.51
  Bottom 0.406: JP202.13 JP202.16 | v79.38,29.51 v86.04,29.51 | v79.38,26.97 66.99,26.97 63.18,30.78 56.83,30.78 53.02,34.59 39.05,34.59 37.78,35.86 IC101.17
L13  (via drill 0.5)
  Top 0.406: JP206.1 92.39,19.35 v86.04,19.35 | v50.8,32.05 53.34,32.05 54.61,30.78 v54.61,27.92 | v64.45,27.92 64.45,20.93 65.41,19.98 65.41,18.39 66.04,17.76 68.9,17.76 70.17,16.49 79.06,16.49 v81.92,19.35
  Bottom 0.406: JP206.1 JP206.4 | IC101.18 37.78,33.32 39.05,32.05 v50.8,32.05 | v54.61,27.92 v64.45,27.92 | v81.92,19.35 v86.04,19.35
L14  (via drill 0.5)
  Top 0.406: JP206.5 92.39,14.27 v86.04,14.27 | v54.93,24.43 v54.93,17.76 | v64.77,16.49 66.04,15.22 68.9,15.22 70.17,13.95 v81.92,13.95
  Bottom 0.406: JP206.5 JP206.8 | IC101.19 37.78,30.78 39.05,29.51 50.48,29.51 51.44,28.55 51.44,25.38 52.39,24.43 v54.93,24.43 | v54.93,17.76 61.91,17.76 63.18,16.49 v64.77,16.49 | v81.92,13.95 82.23,14.27 v86.04,14.27
L15  (via drill 0.5)
  Top 0.406: JP206.9 92.39,9.19 v86.04,9.19 | v49.53,20.62 54.29,15.86 v54.29,7.6 | v82.55,8.87 80.64,10.78 75.25,10.78 73.66,9.19 v73.66,6.33
  Bottom 0.406: JP206.9 JP206.12 | IC101.20 38.1,28.24 39.05,27.29 46.67,27.29 47.94,26.02 48.58,26.02 49.53,25.06 v49.53,20.62 | v54.29,7.6 68.9,7.6 70.17,6.33 v73.66,6.33 | v86.04,9.19 82.87,9.19 v82.55,8.87
L16  (via drill 0.5)
  Top 0.406: JP206.13 92.39,4.11 v86.04,4.11 | IC101.21 48.9,27.92 50.48,26.33 50.48,20.62 55.24,15.86 v55.24,4.11
  Bottom 0.406: JP206.13 JP206.16 | v55.24,4.11 58.1,1.25 83.19,1.25 v86.04,4.11
LED-G
  Bottom 0.406: IC101.2 R103.1
LED-R
  Bottom 0.61: IC101.4 32.07,68.88 R102.1
MISO  (via drill 0.5)
  Top 0.406: v37.47,61.26 v37.47,46.02 | v41.91,46.02 41.91,20.62 40.64,19.35 IC104.15 40.64,15.54 42.86,13.32 v42.86,11.09
  Bottom 0.406: IC101.7 v37.47,61.26 | v37.47,46.02 v41.91,46.02 | SV101.1 52.7,10.14 51.75,11.09 v42.86,11.09 38.1,11.09 36.83,9.82 IC103.2
MOSI  (via drill 0.5)
  Top 0.406: v38.42,63.8 38.42,26.02 39.37,25.06 39.37,20.62 38.1,19.35 IC104.14 38.1,5.06 38.42,4.74 IC103.5
  Bottom 0.406: IC101.6 v38.42,63.8 | IC103.5 48.26,4.74 SV101.4
N$1
  Bottom 0.406: IC105.1 22.23,15.22 27.94,20.93 47.31,20.93 48.26,21.89 IC104.1
N$2  (via drill 0.5)
  Top 0.406: IC105.4 23.5,4.74 24.45,5.7 24.45,15.86 v28.26,19.66 | v45.72,19.66 IC104.2
  Bottom 0.406: v28.26,19.66 v45.72,19.66
N$3
  Bottom 0.406: OK101.3 28.57,49.83 R108.1
N$5
  Top 0.406: R109.2 19.68,55.22 OK101.1
  Bottom 0.406: OK101.1 3.49,53.95 2.22,52.68 2.22,10.14 3.49,8.87 7.56,8.87 X101.3
N$6
  Bottom 0.813: D102.C 28.57,87.93 27.3,86.66 V101.IN 27.3,82.85 29.53,80.62 C105.1 42.55,80.62 C106.+
N$9
  Bottom 0.61: R102.2 16.83,71.1 13.34,74.59 D101.AR
N$13
  Bottom 0.61: R103.2 15.56,73.96 9.84,79.67 D101.AG
N$15  (via drill 0.5)
  Top 0.406: v61.59,46.02 v61.59,39.67
  Bottom 0.406: JP204.2 89.22,47.29 87.31,47.29 86.04,46.02 RN202.2 v61.59,46.02 | v61.59,39.67 IC202.4
N$16  (via drill 0.5)
  Top 0.406: v62.55,43.48 v62.55,37.13
  Bottom 0.406: JP204.4 89.22,44.75 87.31,44.75 86.04,43.48 RN202.3 v62.55,43.48 | v62.55,37.13 IC202.5
N$17  (via drill 0.5)
  Top 0.406: v63.5,34.59 v63.5,40.94
  Bottom 0.406: JP204.6 89.22,42.21 87.31,42.21 86.04,40.94 RN202.4 v63.5,40.94 | IC202.6 v63.5,34.59
N$18  (via drill 0.5)
  Top 0.406: v64.45,32.05 v64.45,38.4
  Bottom 0.406: JP204.8 89.22,39.67 87.31,39.67 86.04,38.4 RN202.5 v64.45,38.4 | IC202.7 v64.45,32.05
N$19
  Bottom 0.406: JP204.10 89.22,37.13 87.31,37.13 86.04,35.86 RN202.6 70.17,35.86 68.9,37.13 IC202.12
N$20
  Bottom 0.406: JP204.12 89.22,34.59 87.31,34.59 86.04,33.32 RN202.7 70.17,33.32 68.9,34.59 IC202.11
N$21
  Bottom 0.406: JP204.14 89.22,32.05 87.31,32.05 86.04,30.78 RN202.8 70.17,30.78 68.9,32.05 IC202.10
N$22
  Bottom 0.406: JP204.16 89.22,29.51 87.31,29.51 86.04,28.24 RN202.9 70.17,28.24 68.9,29.51 IC202.9
N$23  (via drill 0.5)
  Top 0.406: v61.59,92.37 v61.59,86.02
  Bottom 0.406: JP203.2 89.22,95.55 87.31,95.55 86.04,94.28 84.14,94.28 82.23,92.37 RN201.2 v61.59,92.37 | v61.59,86.02 IC201.4
N$24  (via drill 0.5)
  Top 0.406: v62.55,89.83 v62.55,83.48
  Bottom 0.406: JP203.4 89.22,93.01 84.14,93.01 80.96,89.83 RN201.3 v62.55,89.83 | v62.55,83.48 IC201.5
N$25  (via drill 0.5)
  Top 0.406: v63.5,80.94 v63.5,87.29
  Bottom 0.406: JP203.6 89.22,90.47 87.31,90.47 86.04,89.2 82.87,89.2 80.96,87.29 RN201.4 v63.5,87.29 | IC201.6 v63.5,80.94
N$26  (via drill 0.5)
  Top 0.406: v64.45,78.4 v64.45,84.75
  Bottom 0.406: JP203.8 89.22,87.93 82.87,87.93 81.28,86.34 74.61,86.34 73.03,84.75 RN201.5 v64.45,84.75 | IC201.7 v64.45,78.4
N$27
  Bottom 0.406: JP203.16 89.22,77.77 86.04,77.77 80.64,72.37 75.56,72.37 73.34,74.59 RN201.9 70.8,74.59 69.53,75.86 IC201.9
N$28
  Bottom 0.406: JP203.14 89.22,80.31 87.31,80.31 86.04,79.04 85.41,79.04 83.5,77.13 81.6,74.91 80.33,73.64 75.88,73.64 72.39,77.13 RN201.8 70.8,77.13 69.53,78.4 IC201.10
N$29
  Bottom 0.406: JP203.12 89.22,82.85 76.52,82.85 73.34,79.67 RN201.7 70.8,79.67 69.53,80.94 IC201.11
N$31  (via drill 0.5)
  Top 0.406: v61.59,69.2 v61.59,62.84
  Bottom 0.406: JP207.2 89.22,70.15 87.31,70.15 86.36,69.2 RN203.2 v61.59,69.2 | v61.59,62.84 IC203.4
N$32  (via drill 0.5)
  Top 0.406: v62.55,66.66 v62.55,60.3
  Bottom 0.406: JP207.4 89.22,67.61 87.31,67.61 86.36,66.66 RN203.3 v62.55,66.66 | v62.55,60.3 IC203.5
N$33  (via drill 0.5)
  Top 0.406: v63.5,57.76 v63.5,64.12
  Bottom 0.406: JP207.6 89.22,65.07 87.31,65.07 86.36,64.12 RN203.4 v63.5,64.12 | IC203.6 v63.5,57.76
N$34  (via drill 0.5)
  Top 0.406: v64.45,55.22 v64.45,61.57
  Bottom 0.406: JP207.8 89.22,62.53 87.31,62.53 86.36,61.57 RN203.5 v64.45,61.57 | IC203.7 v64.45,55.22
N$35
  Bottom 0.406: JP207.10 89.22,59.99 87.31,59.99 86.36,59.03 RN203.6 70.17,59.03 68.9,60.3 IC203.12
N$36
  Bottom 0.406: JP207.12 89.22,57.45 87.31,57.45 86.36,56.49 RN203.7 70.17,56.49 68.9,57.76 IC203.11
N$37
  Bottom 0.406: JP207.14 89.22,54.91 87.31,54.91 86.36,53.95 RN203.8 70.17,53.95 68.9,55.22 IC203.10
N$38
  Bottom 0.406: JP207.16 88.27,51.41 RN203.9 70.17,51.41 68.9,52.68 IC203.9
N$39  (via drill 0.5)
  Top 0.406: v61.59,22.84 v61.59,16.49
  Bottom 0.406: JP208.2 88.27,22.84 83.82,22.84 80.64,26.02 75.56,26.02 72.39,22.84 RN204.2 v61.59,22.84 | v61.59,16.49 IC204.4
N$40  (via drill 0.5)
  Top 0.406: v62.55,20.3 v62.55,13.95
  Bottom 0.406: JP208.4 89.22,19.35 87.31,19.35 85.72,17.76 75.88,17.76 73.34,20.3 RN204.3 v62.55,20.3 | v62.55,13.95 IC204.5
N$41  (via drill 0.5)
  Top 0.406: v63.5,11.41 v63.5,17.76
  Bottom 0.406: JP208.6 89.22,16.81 75.25,16.81 74.3,17.76 RN204.4 v63.5,17.76 | IC204.6 v63.5,11.41
N$42  (via drill 0.5)
  Top 0.406: v64.45,8.87 v64.45,15.22
  Bottom 0.406: JP208.8 89.22,14.27 87.31,14.27 86.36,15.22 RN204.5 v64.45,15.22 | IC204.7 v64.45,8.87
N$43
  Bottom 0.406: JP208.10 89.22,11.73 87.31,11.73 86.36,12.68 RN204.6 70.17,12.68 68.9,13.95 IC204.12
N$44
  Bottom 0.406: JP208.12 89.22,9.19 87.31,9.19 86.36,10.14 RN204.7 70.17,10.14 68.9,11.41 IC204.11
N$45
  Bottom 0.406: JP208.14 89.22,6.65 87.31,6.65 86.36,7.6 RN204.8 70.17,7.6 68.9,8.87 IC204.10
N$46
  Bottom 0.406: JP208.16 89.22,4.11 87.31,4.11 84.45,6.97 75.88,6.97 73.98,5.06 RN204.9 70.17,5.06 68.9,6.33 IC204.9
N$47
  Bottom 0.406: JP203.10 89.22,85.39 87.31,85.39 86.04,84.12 74.93,84.12 73.03,82.21 RN201.6 70.8,82.21 69.53,83.48 IC201.12
PLUGGED
  Bottom 0.406: IC101.39 37.15,73.96 35.88,75.23 32.07,75.23 26.04,81.26 14.86,81.26 CON101.3
Q-CLK
  Top 0.406: IC101.13 31.43,46.02 30.48,45.06 30.48,28.24 | 30.48,28.24 IC104.8 | 30.48,28.24 QG101.8
SCK  (via drill 0.5)
  Top 0.406: v36.51,58.72 36.51,26.33 36.83,26.02 36.83,20.62 35.56,19.35 IC104.13 v35.56,7.28
  Bottom 0.406: IC101.8 v36.51,58.72 | SV101.3 48.9,7.92 45.72,7.92 45.09,7.28 IC103.6 v35.56,7.28
SCL  (via drill 0.5)
  Top 0.406: v69.22,88.56 v69.22,65.39 v69.22,42.21 v69.22,25.38 v69.22,19.03
  Bottom 0.406: IC201.14 v69.22,88.56 | v69.22,19.03 IC204.14 | v69.22,65.39 IC203.14 | v69.22,42.21 IC202.14 | v69.22,25.38 53.02,25.38 52.39,26.02 R201.2 IC101.22
SDA  (via drill 0.5)
  Top 0.406: v65.41,91.1 v65.41,67.92 v65.41,44.75 v65.41,26.33 v65.41,21.57
  Bottom 0.406: v65.41,91.1 IC201.15 | v65.41,21.57 IC204.15 | v65.41,44.75 IC202.15 | v65.41,67.92 IC203.15 | IC101.23 R202.2 53.02,33.32 53.66,32.68 53.66,26.97 54.29,26.33 v65.41,26.33
SPG
  Bottom 0.61: R106.2 R107.1 52.39,82.21 48.9,78.72 IC101.40
V-NETZTEIL1
  Bottom 1.27: CON101.1 20.95,90.47 D103.A

### Text on the board
Bottom: bottom | MBCAN-Projekt | (c) Dr.-Ing. Th. Wiesner | 06.01.2024 | mbc81.brd
tNames: HW: 24.01.06 | +18V | DC | KEY | LED | (c) Dr.-Ing. Th. Wiesner | MBCAN-Projekt | IN | OUT | mbc-81